# Altium schematic sheet PGA900_AFE_Reserved_5.SchDoc
size A4; SheetNumber: 20; SheetTotal: 21
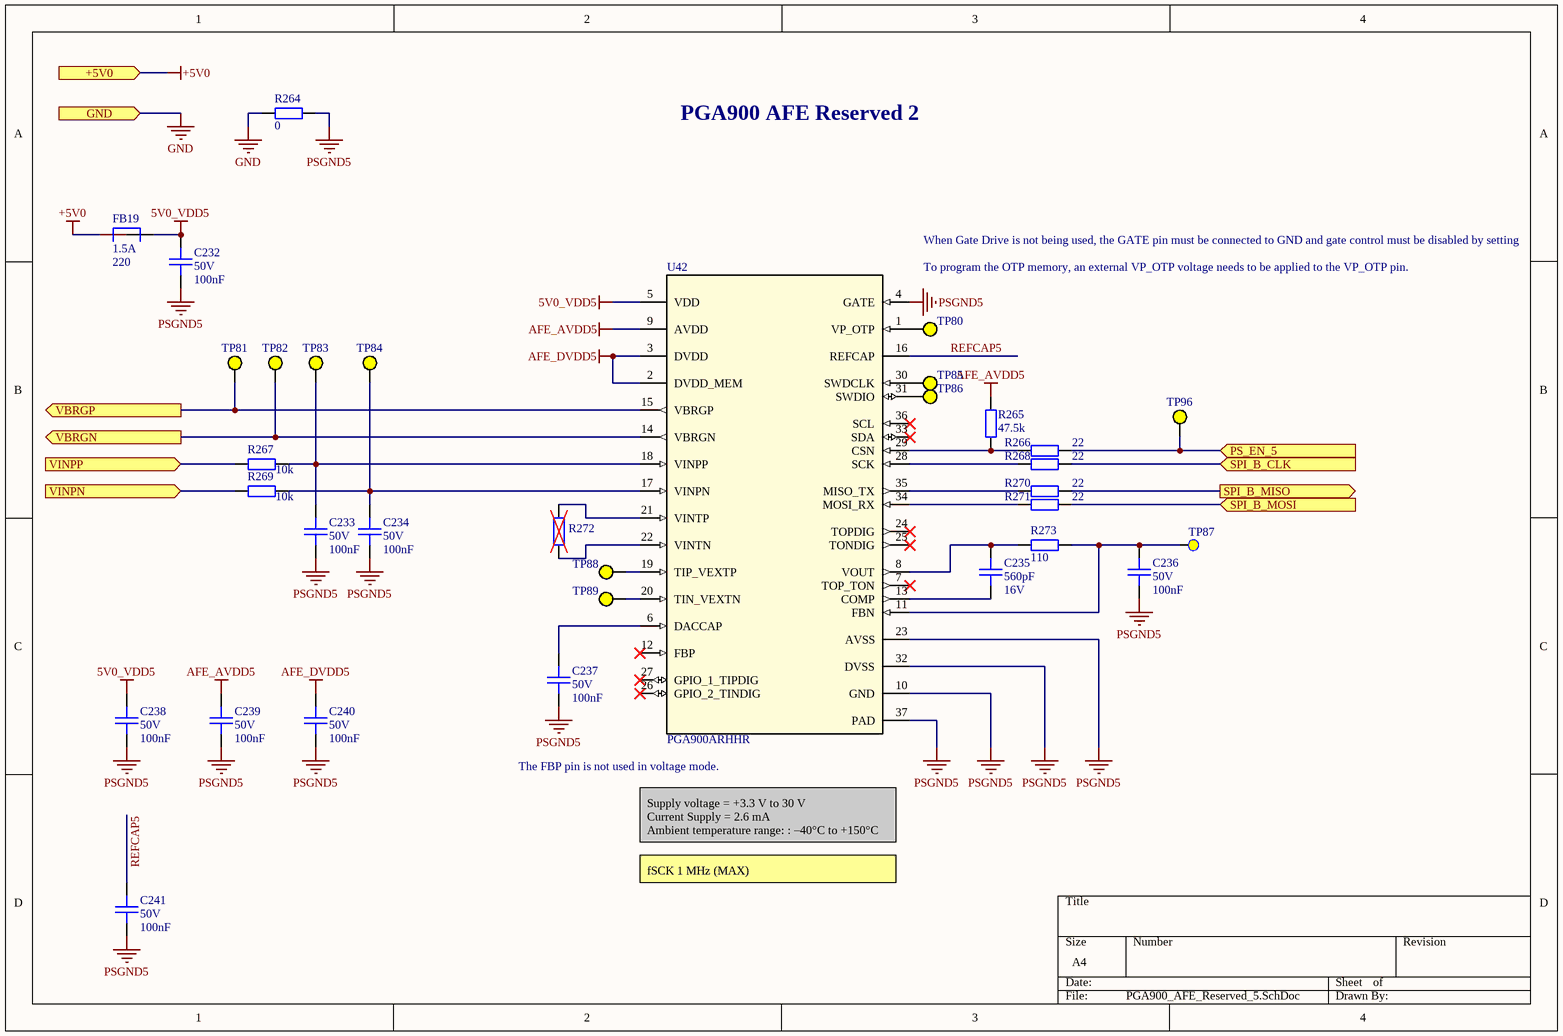
[diagram p0: PGA900_AFE_Reserved_5.SchDoc]

## Parts
C232  Voltage Rating: 50V  Capacitance: 100nF  [CAPC100x50x50L25]  (hidden comment: GCM155L8EH104KE07D)
C233  Voltage Rating: 50V  Capacitance: 100nF  [CAPC100x50x50L25]  (hidden comment: GCM155L8EH104KE07D)
C234  Voltage Rating: 50V  Capacitance: 100nF  [CAPC100x50x50L25]  (hidden comment: GCM155L8EH104KE07D)
C235  Capacitance: 560pF  Voltage Rating: 16V  [CAPC100x50x50L25]  (hidden comment: C0402C561F4HACAUTO)
C236  Voltage Rating: 50V  Capacitance: 100nF  [CAPC100x50x50L25]  (hidden comment: GCM155L8EH104KE07D)
C237  Voltage Rating: 50V  Capacitance: 100nF  [CAPC100x50x50L25]  (hidden comment: GCM155L8EH104KE07D)
C238  Voltage Rating: 50V  Capacitance: 100nF  [CAPC100x50x50L25]  (hidden comment: GCM155L8EH104KE07D)
C239  Voltage Rating: 50V  Capacitance: 100nF  [CAPC100x50x50L25]  (hidden comment: GCM155L8EH104KE07D)
C240  Voltage Rating: 50V  Capacitance: 100nF  [CAPC100x50x50L25]  (hidden comment: GCM155L8EH104KE07D)
C241  Voltage Rating: 50V  Capacitance: 100nF  [CAPC100x50x50L25]  (hidden comment: GCM155L8EH104KE07D)
FB19  Imax: 1.5A  Impedance: 220  [BEADC160X80X95L40]  (hidden comment: BLM18KG221BH1D)
R264  Resistance: 0  [RESC160X80X55L30]  (hidden comment: RC0603FR-070RL)
R265  Resistance: 47.5k  [RESC100X50X40L25]  (hidden comment: RC0402FR-0747K5L)
R266  Resistance: 22  [RESC100X50X40L25]  (hidden comment: RC0402FR-0722RL)
R267  Resistance: 10k  [RESC100X50X40L25]  (hidden comment: RC0402FR-0710KL)
R268  Resistance: 22  [RESC100X50X40L25]  (hidden comment: RC0402FR-0722RL)
R269  Resistance: 10k  [RESC100X50X40L25]  (hidden comment: RC0402FR-0710KL)
R270  Resistance: 22  [RESC100X50X40L25]  (hidden comment: RC0402FR-0722RL)
R271  Resistance: 22  [RESC100X50X40L25]  (hidden comment: RC0402FR-0722RL)
R272  DNP chip res 0603  [RESC160X80X55L30]  (value not drawn)
R273  Resistance: 110  [RESC100X50X40L25]  (hidden comment: RC0402FR-07110RL)
TP80  Test Point  [TP_D1.5mm]  (value not drawn)  (no BOM)
TP81  Test Point  [TP_D0.75mm]  (value not drawn)
TP82  Test Point  [TP_D0.75mm]  (value not drawn)
TP83  Test Point  [TP_D0.75mm]  (value not drawn)
TP84  Test Point  [TP_D0.75mm]  (value not drawn)
TP85  Test Point  [TP_D1.5mm]  (value not drawn)  (no BOM)
TP86  Test Point  [TP_D1.5mm]  (value not drawn)  (no BOM)
TP87  TPAD  [PAD_1.0R]  (value not drawn)  (no BOM)
TP88  Test Point  [TP_D1.5mm]  (value not drawn)  (no BOM)
TP89  Test Point  [TP_D1.5mm]  (value not drawn)  (no BOM)
TP96  Test Point  [TP_D0.75mm]  (value not drawn)
U42  PGA900ARHHR  [36VQFN]

## Ports
+5V0 (in), GND (in), PS_EN_5 (in), SPI_B_CLK (in), SPI_B_MISO (out), SPI_B_MOSI (in), VBRGN (out), VBRGP (out), VINPN (in), VINPP (in)

## Nets
5V0_VDD5: C232.2 C238.2 FB19.2 U42.5(VDD)
+5V0: FB19.1 ; port +5V0
AFE_AVDD5: C239.2 R265.2 U42.9(AVDD)
AFE_DVDD5: C240.2 U42.2(DVDD_MEM) U42.3(DVDD)
GND: R264.2 ; port GND
PSGND5: C232.1 C233.1 C234.1 C236.1 C237.1 C238.1 C239.1 C240.1 C241.1 R264.1 U42.4(GATE) U42.10(GND) U42.23(AVSS) U42.32(DVSS) U42.37(PAD)
PS_EN_5: R266.2 TP96.1 ; port PS_EN_5
REFCAP5: C241.2 U42.16(REFCAP)
SPI_B_CLK: R268.2 ; port SPI_B_CLK
SPI_B_MISO: R270.2 ; port SPI_B_MISO
SPI_B_MOSI: R271.2 ; port SPI_B_MOSI
VBRGN: TP82.1 U42.14(VBRGN) ; port VBRGN
VBRGP: TP81.1 U42.15(VBRGP) ; port VBRGP
VINPN: R269.1 ; port VINPN
VINPP: R267.1 ; port VINPP
NetC233_2: C233.2 R267.2 TP83.1 U42.18(VINPP)
NetC234_2: C234.2 R269.2 TP84.1 U42.17(VINPN)
NetC235_1: C235.1 U42.13(COMP)
NetC235_2: C235.2 R273.1 U42.8(VOUT)
NetC236_2: C236.2 R273.2 TP87.1(TPoint) U42.11(FBN)
NetC237_2: C237.2 U42.6(DACCAP)
NetR265_1: R265.1 R266.1 U42.29(CSN)
NetR268_1: R268.1 U42.28(SCK)
NetR270_1: R270.1 U42.35(MISO_TX)
NetR271_1: R271.1 U42.34(MOSI_RX)
NetR272_1: R272.1 U42.22(VINTN)
NetR272_2: R272.2 U42.21(VINTP)
NetTP80_1: TP80.1 U42.1(VP_OTP)
NetTP85_1: TP85.1 U42.30(SWDCLK)
NetTP86_1: TP86.1 U42.31(SWDIO)
NetTP88_1: TP88.1 U42.19(TIP_VEXTP)
NetTP89_1: TP89.1 U42.20(TIN_VEXTN)

Not connected (* = marked no-connect by the designer): U42 7(TOP_TON)* 12(FBP)* 24(TOPDIG)* 25(TONDIG)* 26(GPIO_2_TINDIG)* 27(GPIO_1_TIPDIG)* 33(SDA)* 36(SCL)*

## Notes on the sheet
- PGA900 AFE Reserved 2
- When Gate Drive is not being used, the GATE pin must be connected to GND and gate control must be disabled by setting
- To program the OTP memory, an external VP_OTP voltage needs to be applied to the VP_OTP pin.
- (near U42) The FBP pin is not used in voltage mode.
- Supply voltage = +3.3 V to 30 V
  Current Supply = 2.6 mA
  Ambient temperature range: : –40°C to +150°C
- fSCK 1 MHz (MAX)

## Library data of the parts
C232-C234 C236-C241 = CMP-001-1980-2: CAP CER 0.1UF 50V X8L 0402; Manufacturer: Murata Electronics; Op Temp max: 150°C; Op Temp min: -55°C; Tolerance: 10%; Height max: 550µm; ComponentLink3Description: Digikey; Mounting Type: SM; ComponentLink3URL: https://www.digikey.com/en/products/detail/murata-electronics/GCM155L8EH104KE07D/11618823; Package: 0402 (1005 Metric); Lead Spacing: 0mm; MPN: GCM155L8EH104KE07D; Size: 1.00mm x 0.50mm; Ratings: AEC-Q200; ComponentLink1URL: https://www.murata.com/en-us/products/productdetail?partno=GCM155L8EH104KE07%23; ComponentLink1Description: Datasheet; Dielectric: X8L; ComponentLink2Description: Mouser; ComponentLink2URL: https://eu.mouser.com/ProductDetail/Murata-Electronics/GCM155L8EH104KE07D?qs=1mbolxNpo8fQSHf0HYnZWw%3D%3D
C235 = CMP-001-2011-2: CAP CER 0402 560PF 16V ULTRA STA; Manufacturer: KEMET; Dielectric: X8R; Tolerance: 1%; Op Temp max: 150°C; Op Temp min: -55°C; Package: 0402 (1005 Metric); MPN: C0402C561F4HACAUTO; ComponentLink3Description: Digikey; Mounting Type: SM; Height max: 550µm; Lead Spacing: 0mm; ComponentLink1Description: Datasheet; ComponentLink3URL: https://www.digikey.com/en/products/detail/kemet/C0402C561F4HACAUTO/7955183?s=N4IgjCBcpgbFoDGUBmBDANgZwKYBoQB7KAbRAGYBOMAVgA4QBdAgBwBcoQBlNgJwEsAdgHMQAXwJgA7AhDJI6bPiKkQAFgBMGzfGYh2nHgJHiCGmhtnzFuAsUhltGyuQh6DkbnyGiJ4SnSUVqiYtioOIAAMTH4akWpB0HIhSnaqNLCRAAQsAGJMrByeAKqC-GwA8igAsjhoWACuvDimIAC0lknyfA3K9mQ0MbHpmSwoMUA; ComponentLink2URL: https://eu.mouser.com/ProductDetail/KEMET/C0402C561F4HACAUTO?qs=j%252B1pi9TdxUZljUlO6hXHJQ%3D%3D; ComponentLink2Description: Mouser; ComponentLink1URL: https://www.kemet.com/en/us/product/C0402C561F4HACAUTO.html; Ratings: AEC-Q200; Size: 1.00mm x 0.50mm
FB19 = CMP-001-1981-1: FERRITE BEAD 220 OHM 0603 1LN; Manufacturer: Murata Electronics; DCR: 50m; Op Temp min: -55°C; Frequency: 100MHz; Op Temp max: 150°C; Number of Lines: 1; Mounting Type: SM; Size: 1.60mm x 0.80mm; ComponentLink2URL: https://eu.mouser.com/ProductDetail/Murata-Electronics/BLM18KG221BH1D?qs=sJ5gq5MLFXpgEHYBdWUtkQ%3D%3D; ComponentLink1Description: Datasheet; ComponentLink1URL: https://www.murata.com/en-us/products/productdata/8798137286686/QNFA9129.pdf; Lead Spacing: 0mm; Ratings: AEC-Q200; ComponentLink3Description: Digikey; ComponentLink3URL: https://www.digikey.com/en/products/detail/murata-electronics/BLM18KG221BH1D/6156000; Height max: 950µm; Package: 0603 (1608 Metric); ComponentLink2Description: Mouser; MPN: BLM18KG221BH1D
R264 = CMP-001-0927-2: RES 0 OHM JUMPER 1/10W 0603; Manufacturer: YAGEO; Op Temp min: -55°C; Op Temp max: 155°C; Power: 100mW; Tolerance: 0%; Height max: 550µm; ComponentLink2URL: https://eu.mouser.com/ProductDetail/YAGEO/RC0603FR-070RL?qs=0yPvnVz5%2FmpDQv43TwvCfw%3D%3D; Temperature Coefficient: -; ComponentLink3Description: Digikey; ComponentLink2Description: Mouser; MPN: RC0603FR-070RL; ComponentLink1URL: https://www.yageo.com/upload/media/product/productsearch/datasheet/rchip/PYu-RC_Group_51_RoHS_L_12.pdf; Ratings: -; Size: 1.60mm x 0.80mm; Composition: Thick Film; Mounting Type: SM; ComponentLink3URL: https://www.digikey.com/en/products/detail/yageo/RC0603FR-070RL/1304008; Package: 0603 (1608 Metric); ComponentLink1Description: Datasheet
R265 = CMP-001-0277-7: RES 47.5K OHM 1% 1/16W 0402; Manufacturer: YAGEO; Op Temp min: -55°C; Power: 63mW; Temperature Coefficient: ±100ppm; Op Temp max: 155°C; ComponentLink1URL: https://www.yageo.com/upload/media/product/productsearch/datasheet/rchip/PYu-RC_Group_51_RoHS_L_12.pdf; ComponentLink1Description: Datasheet; MPN: RC0402FR-0747K5L; ComponentLink3Description: Digikey; ComponentLink2URL: https://eu.mouser.com/ProductDetail/YAGEO/RC0402FR-0747K5L?qs=V1yeUXFNrklfu86Rfgihxg%3D%3D; Mounting Type: SM; Tolerance: 1%; Package: 0402 (1005 Metric); Height max: 400µm; ComponentLink2Description: Mouser; ComponentLink3URL: https://www.digikey.com/en/products/detail/yageo/RC0402FR-0747K5L/726617; Size: 1.00mm x 0.50mm; Composition: Thick Film; Ratings: -
R266 R268 R270 R271 = CMP-001-0482-4: RES 22 OHM 1% 1/16W 0402; Manufacturer: YAGEO; Temperature Coefficient: ±100ppm; Op Temp max: 155°C; Op Temp min: -55°C; Power: 63mW; Ratings: -; ComponentLink3URL: https://www.digikey.com/en/products/detail/yageo/RC0402FR-0722RL/726562; ComponentLink2URL: https://eu.mouser.com/ProductDetail/YAGEO/RC0402FR-0722RL?qs=V1yeUXFNrkkRg6zf08ADKQ%3D%3D; MPN: RC0402FR-0722RL; ComponentLink1Description: Datasheet; ComponentLink3Description: Digikey; Tolerance: 1%; Size: 1.00mm x 0.50mm; ComponentLink1URL: https://www.yageo.com/upload/media/product/productsearch/datasheet/rchip/PYu-RC_Group_51_RoHS_L_12.pdf; Composition: Thick Film; ComponentLink2Description: Mouser; Mounting Type: SM; Package: 0402 (1005 Metric); Height max: 400µm
R267 R269 = CMP-00010-6: RES 10K OHM 1% 1/16W 0402; Manufacturer: YAGEO; Op Temp max: 155°C; Op Temp min: -55°C; Power: 63mW; Temperature Coefficient: ±100ppm; ComponentLink3URL: https://www.digikey.com/en/products/detail/yageo/RC0402FR-0710KL/726523; ComponentLink1Description: Datasheet; Height max: 400µm; ComponentLink3Description: Digikey; ComponentLink2URL: https://www2.mouser.com/ProductDetail/YAGEO/RC0402FR-0710KL?qs=%2Fha2pyFaduhjtLcYvKXQ8NAGbRXkQ%2Fwl6RsvWHeV66MSeqLhkcF3rg%3D%3D; Ratings: -; MPN: RC0402FR-0710KL; ComponentLink1URL: https://www.yageo.com/upload/media/product/productsearch/datasheet/rchip/PYu-RC_Group_51_RoHS_L_12.pdf; ComponentLink2Description: Mouser; Mounting Type: SM; Tolerance: 1%; Composition: Thick Film; Size: 1.00mm x 0.50mm; Package: 0402 (1005 Metric)
R272 = CMP-001-0920-3: DNP res 0603; Mounting Type: SM; MPN: DNP; Package: 0603 (1608 Metric)
R273 = CMP-001-0497-6: RES 110 OHM 1% 1/16W 0402; Manufacturer: YAGEO; Power: 63mW; Op Temp min: -55°C; Op Temp max: 155°C; Temperature Coefficient: ±100ppm; Size: 1.00mm x 0.50mm; ComponentLink1Description: Datasheet; Package: 0402 (1005 Metric); ComponentLink2URL: https://eu.mouser.com/ProductDetail/YAGEO/RC0402FR-07110RL?qs=QWYorlrD8IXj7iGvwWbRbA%3D%3D; MPN: RC0402FR-07110RL; ComponentLink3Description: Digikey; Height max: 400µm; Ratings: -; ComponentLink3URL: https://www.digikey.com/en/products/detail/yageo/RC0402FR-07110RL/2827583; Composition: Thick Film; ComponentLink2Description: Mouser; Tolerance: 1%; Mounting Type: SM; ComponentLink1URL: https://www.yageo.com/upload/media/product/productsearch/datasheet/rchip/PYu-RC_Group_51_RoHS_L_12.pdf
TP80 TP85 TP86 TP88 TP89 = TP_1.5
TP81-TP84 TP96 = TP_0.75: Test point 0.75mm
TP87 = TPAD: Test Pad, SMD; Group: Test point
U42 = PGA900ARHHR: IC PROG SENSOR SGNL COND 36VQFN; Manufacturer: Texas Instruments; MPN: PGA900ARHHR